# Altium schematic sheet UWB_Sheet.SchDoc
size 420 x 297 mm; SheetNumber: 3; SheetTotal: 5
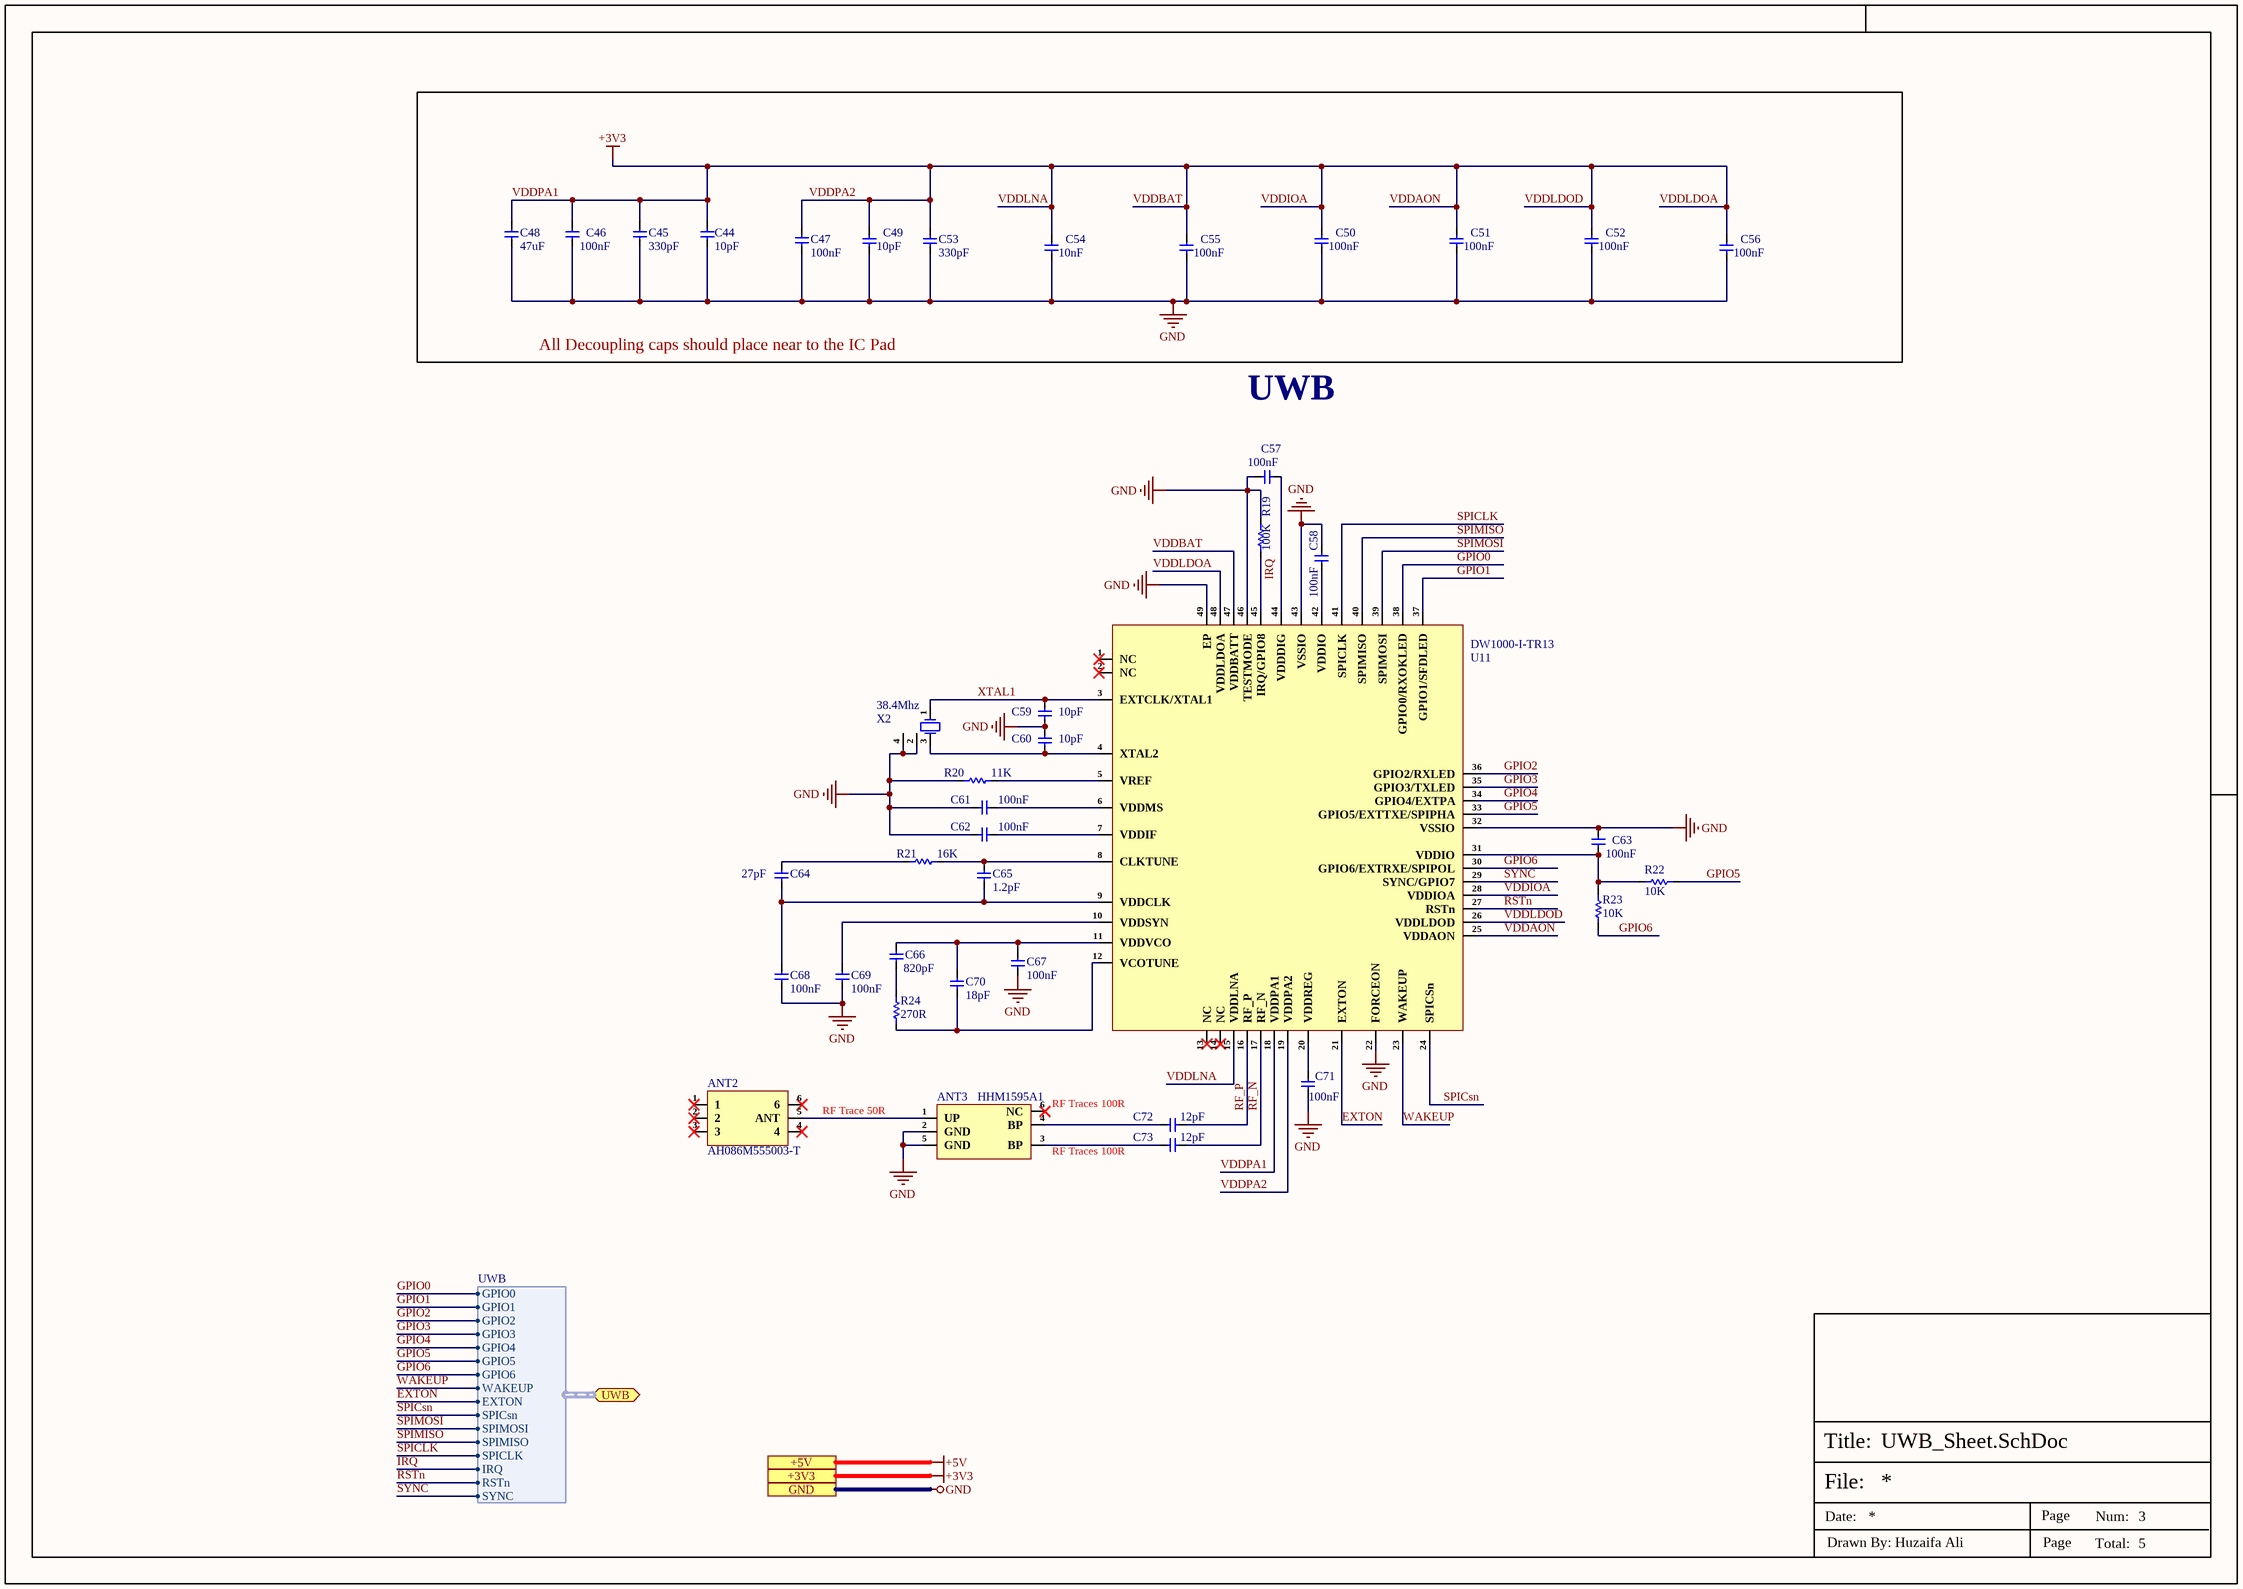
[diagram p0: UWB_Sheet.SchDoc]

## Parts
ANT2  AH086M555003-T  [AH086M555003-T]
ANT3  HHM1595A1  [HHM1595A1]
C44  10pF  [Cap-0402]
C45  330pF  [Cap-0402]
C46  100nF  [Cap-0402]
C47  100nF  [Cap-0402]
C48  47uF  [Cap-0603]
C49  10pF  [Cap-0402]
C50  100nF  [Cap-0402]
C51  100nF  [Cap-0402]
C52  100nF  [Cap-0402]
C53  330pF  [Cap-0402]
C54  10nF  [Cap-0402]
C55  100nF  [Cap-0402]
C56  100nF  [Cap-0402]
C57  100nF  [Cap-0402]
C58  100nF  [Cap-0402]
C59  10pF  [Cap-0402]
C60  10pF  [Cap-0402]
C61  100nF  [Cap-0402]
C62  100nF  [Cap-0402]
C63  100nF  [Cap-0402]
C64  27pF  [Cap-0402]
C65  1.2pF  [Cap-0402]
C66  820pF  [Cap-0603]
C67  100nF  [Cap-0402]
C68  100nF  [Cap-0402]
C69  100nF  [Cap-0402]
C70  18pF  [CAP-0201]
C71  100nF  [Cap-0402]
C72  12pF  [Cap-0402]
C73  12pF  [Cap-0402]
R19  100K  [Res-0402]
R20  11K  [Res-0402]
R21  16K  [Res-0201]
R22  10K  [Res-0402]
R23  10K  [Res-0402]
R24  270R  [Res-0402]
U11  DW1000-I-TR13  [QFN-48-EP(6x6)]
X2  38.4Mhz  [XC21M4-38.400-F10NNHPK]

## Blocks framed on the sheet
All Decoupling caps should place near to the IC Pad: C44-C56

## Ports
+3V3, +5V, GND, UWB (bidir, harness UWB)

## Harnesses
UWB: GPIO0, GPIO1, GPIO2, GPIO3, GPIO4, GPIO5, GPIO6, WAKEUP, EXTON, SPICsn, SPIMOSI, SPIMISO, SPICLK, IRQ, RSTn, SYNC

## Nets
+5V: port +5V
GND: ANT3.2(GND) ANT3.5(GND) C44.1 C45.1 C46.1 C47.2 C48.1 C49.1 C50.1 C51.1 C52.1 C53.1 C54.1 C55.1 C56.1 C57.1 C58.2 C59.1 C60.2 C61.2 C62.2 C63.2 C67.1 C68.1 C69.1 C71.2 R19.2 R20.1 U11.22(FORCEON) U11.32(VSSIO) U11.43(VSSIO) U11.46(TESTMODE) U11.49(EP) X2.2(GND) X2.4(GND) ; port GND
VDDAON: C44.2 C45.2 C46.2 C47.1 C48.2 C49.2 C50.2 C51.2 C52.2 C53.2 C54.2 C55.2 C56.2 U11.15(VDDLNA) U11.18(VDDPA1) U11.19(VDDPA2) U11.25(VDDAON) U11.26(VDDLDOD) U11.28(VDDIOA) U11.47(VDDBATT) U11.48(VDDLDOA) ; port +3V3  [also labelled +3V3, VDDBAT, VDDIOA, VDDLDOA, VDDLDOD, VDDLNA, VDDPA1, VDDPA2]
EXTON: U11.21(EXTON) ; port UWB.EXTON
GPIO0: U11.38(GPIO0/RXOKLED) ; port UWB.GPIO0
GPIO1: U11.37(GPIO1/SFDLED) ; port UWB.GPIO1
GPIO2: U11.36(GPIO2/RXLED) ; port UWB.GPIO2
GPIO3: U11.35(GPIO3/TXLED) ; port UWB.GPIO3
GPIO4: U11.34(GPIO4/EXTPA) ; port UWB.GPIO4
GPIO5: R22.2 U11.33(GPIO5/EXTTXE/SPIPHA) ; port UWB.GPIO5
GPIO6: R23.1 U11.30(GPIO6/EXTRXE/SPIPOL) ; port UWB.GPIO6
IRQ: R19.1 U11.45(IRQ/GPIO8) ; port UWB.IRQ
RF_N: C73.2 U11.17(RF_N)
RF_P: C72.2 U11.16(RF_P)
RSTn: U11.27(RSTn) ; port UWB.RSTn
SPICLK: U11.41(SPICLK) ; port UWB.SPICLK
SPICsn: U11.24(SPICSn) ; port UWB.SPICsn
SPIMISO: U11.40(SPIMISO) ; port UWB.SPIMISO
SPIMOSI: U11.39(SPIMOSI) ; port UWB.SPIMOSI
SYNC: U11.29(SYNC/GPIO7) ; port UWB.SYNC
WAKEUP: U11.23(WAKEUP) ; port UWB.WAKEUP
XTAL1: C59.2 U11.3(EXTCLK/XTAL1) X2.1(OSC1)
NetANT2_5: ANT2.5(ANT) ANT3.1(UP)
NetANT3_3: ANT3.3(BP) C73.1
NetANT3_4: ANT3.4(BP) C72.1
NetC57_2: C57.2 U11.44(VDDDIG)
NetC58_1: C58.1 U11.42(VDDIO)
NetC60_1: C60.1 U11.4(XTAL2) X2.3(OSC2)
NetC61_1: C61.1 U11.6(VDDMS)
NetC62_1: C62.1 U11.7(VDDIF)
NetC63_1: C63.1 R22.1 R23.2 U11.31(VDDIO)
NetC64_1: C64.1 C65.1 C68.2 U11.9(VDDCLK)
NetC64_2: C64.2 R21.1
NetC65_2: C65.2 R21.2 U11.8(CLKTUNE)
NetC66_1: C66.1 R24.2
NetC66_2: C66.2 C67.2 C70.2 U11.11(VDDVCO)
NetC69_2: C69.2 U11.10(VDDSYN)
NetC70_1: C70.1 R24.1 U11.12(VCOTUNE)
NetC71_1: C71.1 U11.20(VDDREG)
NetR20_2: R20.2 U11.5(VREF)

Not connected (* = marked no-connect by the designer): ANT2 1* 2* 3* 4* 6*; ANT3 6(NC)*; U11 1(NC)* 2(NC)* 13(NC)* 14(NC)*

## Notes on the sheet
- UWB
- RF Trace 50R
- (near ANT3) RF Traces 100R
- File:
- Title:
- Date:
- Page
- Num:
- Total:
- Drawn By: Huzaifa Ali

## Library data of the parts
ANT2 = AH086M555003-T: RF ANT 3.5GHZ/5.6GHZ CHIP SLD; Manufacturer: Taiyo Yuden; Item Type: RF Antennas; Supplier: Digikey; LCSC Part Number: C94132; Manufacturer Part Number: AH086M555003-T; RoHS: Yes; Stock: 4192; Pricing: 1=7.98, 10=5.341, 25=4.6536, 100=3.8766, 250=3.49504, 500=3.375 (USD); ComponentLink1URL: https://datasheet.ciiva.com/2791/ah-086m555003-ss-2791894.pdf?src-supplier=Digikey; ComponentLink1Description: https://datasheet.ciiva.com/2791/ah-086m555003-ss-2791894.pdf?src-supplier=Digikey; ComponentLink2URL: https://datasheet.ciiva.com/28414/1918813-28414122.pdf?src-supplier=Element14; ComponentLink2Description: https://datasheet.ciiva.com/28414/1918813-28414122.pdf?src-supplier=Element14; ComponentLink3URL: https://datasheet.ciiva.com/3306/chipantenna01-e-3306567.pdf?src-supplier=Avnet; ComponentLink3Description: https://datasheet.ciiva.com/3306/chipantenna01-e-3306567.pdf?src-supplier=Avnet; ComponentLink4URL: https://datasheet.ciiva.com/8153/chipantenna01-e-8153000.pdf?src-supplier=Avnet; ComponentLink4Description: https://datasheet.ciiva.com/8153/chipantenna01-e-8153000.pdf?src-supplier=Avnet; ComponentLink5URL: https://datasheet.ciiva.com/1125/chipantenna01-e-1125194.pdf?src-supplier=Element14; ComponentLink5Description: https://datasheet.ciiva.com/1125/chipantenna01-e-1125194.pdf?src-supplier=Element14; ComponentLink6URL: https://datasheet.ciiva.com/2791/chipantenna01-e-2791895.pdf?src-supplier=Digikey; ComponentLink6Description: https://datasheet.ciiva.com/2791/chipantenna01-e-2791895.pdf?src-supplier=Digikey; ComponentLink7URL: https://datasheet.ciiva.com/2791/chipantenna01-e-2791896.pdf?src-supplier=Digikey; ComponentLink7Description: https://datasheet.ciiva.com/2791/chipantenna01-e-2791896.pdf?src-supplier=Digikey
ANT3 = HHM1595A1: BALUN 3GHZ-8GHZ 50/100 0805; Manufacturer: TDK; Item Type: C112665; Supplier: Digikey; LCSC Part Number: C112665; Manufacturer Part Number: HHM1595A1; RoHS: Yes; Stock: 8835; Pricing: 1=0.34, 10=0.312, 25=0.3008, 50=0.292, 100=0.2836, 250=0.27264, 500=0.26456, 1000=0.25667 (USD); ComponentLink1URL: https://datasheet.ciiva.com/4547/e751-multibalun-hhm18-20070-4547862.pdf?src-supplier=Mouser; ComponentLink1Description: https://datasheet.ciiva.com/4547/e751-multibalun-hhm18-20070-4547862.pdf?src-supplier=Mouser; ComponentLink2URL: https://datasheet.ciiva.com/30013/rf-balun-hhm1595a1-en-30013313.pdf?src-supplier=Avnet; ComponentLink2Description: https://datasheet.ciiva.com/30013/rf-balun-hhm1595a1-en-30013313.pdf?src-supplier=Avnet; ComponentLink3URL: https://datasheet.ciiva.com/2788/rf-balun-hhm1583b1-en-2788708.pdf?src-supplier=Digikey; ComponentLink3Description: https://datasheet.ciiva.com/2788/rf-balun-hhm1583b1-en-2788708.pdf?src-supplier=Digikey; ComponentLink4URL: https://datasheet.ciiva.com/2788/rf-balun-hhm1583b1-en-2788709.pdf?src-supplier=Digikey; ComponentLink4Description: https://datasheet.ciiva.com/2788/rf-balun-hhm1583b1-en-2788709.pdf?src-supplier=Digikey; ComponentLink5URL: https://datasheet.ciiva.com/2788/rf-balun-hhm1583b1-en-2788710.pdf?src-supplier=Digikey; ComponentLink5Description: https://datasheet.ciiva.com/2788/rf-balun-hhm1583b1-en-2788710.pdf?src-supplier=Digikey
C44 C49 C59 C60 = GRM1555C1H100JA01D: CAP CER 10PF 50V C0G/NP0 0402; Manufacturer: Murata; Material: Ceramic; Dielectric: C0G; Tolerance: 5%; Item Type: Capacitor; Supplier: Arrow Electronics; Supplier Part Number: GRM1555C1H100JA01D; Manufacturer Part Number: GRM1555C1H100JA01D; RoHS: Yes; Category: Ceramic Capacitors; Stock: 3860000; Pricing: 10000=0.0034, 50000=0.0027, 100000=0.0023, 250000=0.0021 (USD); Mounting Technology: Surface Mount; Case/Package: 0402; Case Code (Metric): 1005; Case Code (Imperial): 0402; Min Operating Temperature: -55°C; Max Operating Temperature: 125°C; Value: 10pF; Voltage Rating: 50V; Packaging: Tape and Reel; Package Quantity: 1; Voltage Rating (DC): 50V; Termination: SMD/SMT; Series: GRM; Voltage: 50V; Construction: Flat; Length: 1mm; Width: 0.02inch; Height: 0.5mm; Depth: 0.5mm; Thickness: 0.022inch; Radiation Hardening: No; RoHS Compliant: Yes; Lead Free: Lead Free; Reach SVHC Compliant: No; ComponentLink1URL: https://datasheet.ciiva.com/2989/product-2989280.pdf?src-supplier=Avnet; ComponentLink1Description: https://datasheet.ciiva.com/2989/product-2989280.pdf?src-supplier=Avnet; ComponentLink2URL: https://datasheet.ciiva.com/18184/getdatasheetpartid-307234-18184164.pdf?src-supplier=Verical; ComponentLink2Description: https://datasheet.ciiva.com/18184/getdatasheetpartid-307234-18184164.pdf?src-supplier=Verical; ComponentLink3URL: https://datasheet.ciiva.com/29200/453545-da-01-en-vs-kondensator-0402-29200107.pdf?src-supplier=Conrad; ComponentLink3Description: https://datasheet.ciiva.com/29200/453545-da-01-en-vs-kondensator-0402-29200107.pdf?src-supplier=Conrad; ComponentLink4URL: https://datasheet.ciiva.com/7828/1666664-7828812.pdf?src-supplier=Element14; ComponentLink4Description: https://datasheet.ciiva.com/7828/1666664-7828812.pdf?src-supplier=Element14; ComponentLink5URL: https://datasheet.ciiva.com/6271/partnumbering-e-01-6271159.pdf?src-supplier=Digi-Key; ComponentLink5Description: https://datasheet.ciiva.com/6271/partnumbering-e-01-6271159.pdf?src-supplier=Digi-Key; ComponentLink6URL: https://datasheet.ciiva.com/6271/partnumbering-e-01-6271158.pdf?src-supplier=Digi-Key; ComponentLink6Description: https://datasheet.ciiva.com/6271/partnumbering-e-01-6271158.pdf?src-supplier=Digi-Key; ComponentLink7URL: https://datasheet.ciiva.com/6271/partnumbering-e-01-6271068.pdf?src-supplier=Digi-Key; ComponentLink7Description: https://datasheet.ciiva.com/6271/partnumbering-e-01-6271068.pdf?src-supplier=Digi-Key; LCSC Part Number: C76946
C45 C53 = CC0402JRX7R9BB331: CAP CER 330PF 50V X7R 0402; Manufacturer: Yageo; Item Type: Capacitors; Supplier: Digikey; LCSC Part Number: C325463; Manufacturer Part Number: CC0402JRX7R9BB331; RoHS: Yes; Stock: 55732; Pricing: 1=0.1, 10=0.028, 100=0.0157, 1000=0.00973, 2500=0.00781, 5000=0.00736 (USD); Pins: 2NUMBER; Lead Free: 5697LeadFree; RoHS Compliant: 5897YesNo; ComponentLink1URL: https://datasheet.ciiva.com/13263/upy-gphc-x7r-6-3v-to-50v-8-12304-13263927.pdf?src-supplier=Mouser; ComponentLink1Description: https://datasheet.ciiva.com/13263/upy-gphc-x7r-6-3v-to-50v-8-12304-13263927.pdf?src-supplier=Mouser
C46 C47 C50-C52 C55-C58 C61-C63 C67-C69 C71 = GRM155R71H104KE14D: CAP CER 0.1UF 50V X7R 0402; Manufacturer: Murata; Item Type: Capacitors; Material: Ceramic; Tolerance: 10%; Dissipation Factor: 0.025%; Supplier: Future Electronics; LCSC Part Number: C77020; Manufacturer Part Number: GRM155R71H104KE14D; RoHS: Yes; Stock: 45820000; Pricing: 10000=0.0034, 40000=0.0033, 150000=0.0032, 250000=0.0031, 500000=0.003 (USD); Mounting Technology: Surface Mount; Case/Package: 0402; Pins: 2NUMBER; Case Code (Metric): 1005; Case Code (Imperial): 0402; Weight: 0.000212oz; Dielectric Material: Ceramic; Min Operating Temperature: -55°C; Max Operating Temperature: 125°C; Packaging: Tape and Reel; Dielectric: X7R; Value: 100nF; Voltage Rating: 50V; Termination: SMD/SMT; Voltage: 50V; Voltage Rating (DC): 50V; Package Quantity: 10000; Series: GRM; Construction: Flat; Length: 1mm; Width: 0.5mm; Height: 0.5mm; Thickness: 0.022inch; Depth: 0.5mm; Lead Free: 5697LeadFree; Reach SVHC Compliant: No; RoHS Compliant: Yes; ComponentLink1URL: http://www.farnell.com/datasheets/2079156.pdf?src-supplier=Farnell; ComponentLink1Description: http://www.farnell.com/datasheets/2079156.pdf?src-supplier=Farnell; ComponentLink2URL: http://www.mouser.com/ds/2/281/c02e-2905.pdf?src-supplier=Mouser; ComponentLink2Description: http://www.mouser.com/ds/2/281/c02e-2905.pdf?src-supplier=Mouser; ComponentLink3URL: https://datasheet.octopart.com/GRM155R71H104KE14D-Murata-datasheet-22122223.pdf?src-supplier=Future+Electronics; ComponentLink3Description: https://datasheet.octopart.com/GRM155R71H104KE14D-Murata-datasheet-22122223.pdf?src-supplier=Future+Electronics; ComponentLink4URL: http://www.farnell.com/datasheets/2079156.pdf?src-supplier=Newark; ComponentLink4Description: http://www.farnell.com/datasheets/2079156.pdf?src-supplier=Newark; ComponentLink5URL: https://datasheet.octopart.com/GRM155R71H104KE14D-Murata-datasheet-66077078.pdf?src-supplier=Element14; ComponentLink5Description: https://datasheet.octopart.com/GRM155R71H104KE14D-Murata-datasheet-66077078.pdf?src-supplier=Element14; ComponentLink6URL: https://search.murata.co.jp/Ceramy/image/img/A01X/G101/ENG/GRM155R71H104KE14-01.pdf?src-supplier=Digikey; ComponentLink6Description: https://search.murata.co.jp/Ceramy/image/img/A01X/G101/ENG/GRM155R71H104KE14-01.pdf?src-supplier=Digikey
C48 = GRM188R60J476ME15D: CAP CER 47UF 6.3V X5R 0603; Manufacturer: Murata; Item Type: Capacitors; Material: 4241ConductorMaterial; Dielectric: 1537DielectricType; Supplier: Future Electronics; LCSC Part Number: C140782; Manufacturer Part Number: GRM188R60J476ME15D; RoHS: Yes; Stock: 324000; Pricing: 4000=0.108, 8000=0.106, 12000=0.105, 16000=0.104, 20000=0.102 (USD); Voltage Rating (DC): 6.3V; Height: 1mm; ComponentLink1URL: https://datasheet.octopart.com/GRM188R60J476ME15D-Murata-datasheet-149523200.pdf?src-supplier=Newark; ComponentLink1Description: https://datasheet.octopart.com/GRM188R60J476ME15D-Murata-datasheet-149523200.pdf?src-supplier=Newark; ComponentLink2URL: https://datasheet.octopart.com/GRM188R60J476ME15D-Murata-datasheet-102370999.pdf?src-supplier=Future+Electronics; ComponentLink2Description: https://datasheet.octopart.com/GRM188R60J476ME15D-Murata-datasheet-102370999.pdf?src-supplier=Future+Electronics; ComponentLink3URL: https://www.murata.com/~/media/webrenewal/support/library/catalog/products/capacitor/mlcc/c02e.ashx?la=en-us&src-supplier=Digikey; ComponentLink3Description: https://www.murata.com/~/media/webrenewal/support/library/catalog/products/capacitor/mlcc/c02e.ashx?la=en-us&src-supplier=Digikey; ComponentLink4URL: http://search.murata.co.jp/Ceramy/image/img/A01X/G101/ENG/GRM188R60J476ME15-01.pdf?src-supplier=Digikey; ComponentLink4Description: http://search.murata.co.jp/Ceramy/image/img/A01X/G101/ENG/GRM188R60J476ME15-01.pdf?src-supplier=Digikey; ComponentLink5URL: https://datasheet.octopart.com/GRM188R60J476ME15D-Murata-datasheet-165579666.pdf?src-supplier=TME; ComponentLink5Description: https://datasheet.octopart.com/GRM188R60J476ME15D-Murata-datasheet-165579666.pdf?src-supplier=TME
C54 = GCM155R71H103JA55D: CAP CER 10000PF 50V X7R 0402; Manufacturer: Murata; Tolerance: 5%; Item Type: Capacitor; Supplier: Digikey; Supplier Part Number: 490-14352-2-ND; Manufacturer Part Number: GCM155R71H103JA55D; RoHS: Yes; Category: Ceramic Capacitors; Mounting Technology: Surface Mount; Case/Package: 0402; Case Code (Imperial): 0402; Case Code (Metric): 1005; Min Operating Temperature: -55°C; Max Operating Temperature: 125°C; Packaging: Cut Tape; Value: 10nF; Voltage Rating: 50V; Series: GCM; Ratings: AEC-Q200; RoHS Compliant: Yes; ComponentLink1URL: http://search.murata.co.jp/Ceramy/image/img/A01X/partnumbering_e_02.pdf?src-supplier=Digikey; ComponentLink1Description: http://search.murata.co.jp/Ceramy/image/img/A01X/partnumbering_e_02.pdf?src-supplier=Digikey; ComponentLink2URL: http://search.murata.co.jp/Ceramy/image/img/A01X/G101/ENG/GCM155R71H103JA55-01.pdf?src-supplier=Digikey; ComponentLink2Description: http://search.murata.co.jp/Ceramy/image/img/A01X/G101/ENG/GCM155R71H103JA55-01.pdf?src-supplier=Digikey; LCSC Part Number: C5189696
C64 = 0402N270J250CT: CAP CER 27PF 25V C0G/NP0 0402; Manufacturer: Walsin Technologies; Item Type: Capacitor; Supplier 1: Digi-Key; Manufacturer Part Number: 0402N270J250CT; Stock 1: 71180; Pricing 1: 1=0.1, 10=0.017, 50=0.0094, 100=0.0076, 500=0.00544, 1000=0.00427, 2500=0.00388, 5000=0.00357 (USD); RoHS Compliant: Yes; Supplier Part Number 1: 1292-1291-1-ND; LCSC Part Number: C424826; ComponentLink1Description: LCSC; ComponentLink1URL: https://lcsc.com/product-detail/Multilayer-Ceramic-Capacitors-MLCC-SMD-SMT_Walsin-Tech-Corp-0402N270J250CT_C424826.html
C65 = CC0402BRNPO9BN1R2: CAP CER 1.2PF 50V C0G/NPO 0402; Manufacturer: Yageo; Item Type: Capacitor; Temperature Coefficient: 30ppm/°C; Supplier: Digikey; LCSC Part Number: C327292; Manufacturer Part Number: CC0402BRNPO9BN1R2; RoHS: Yes; Stock: 92678; Pricing: 1=0.1, 10=0.032, 50=0.0184, 100=0.0142, 500=0.01068, 1000=0.00839, 2500=0.00762, 5000=0.00702 (USD); Halogen Free: 5694HalogenFree; ComponentLink1URL: https://datasheet.ciiva.com/13386/upy-gp-np0-16v-to-50v-8-13386283.pdf?src-supplier=Mouser; ComponentLink1Description: https://datasheet.ciiva.com/13386/upy-gp-np0-16v-to-50v-8-13386283.pdf?src-supplier=Mouser; ComponentLink2URL: https://datasheet.ciiva.com/15189/getdatasheetpartid-468320-15189100.pdf?src-supplier=Verical; ComponentLink2Description: https://datasheet.ciiva.com/15189/getdatasheetpartid-468320-15189100.pdf?src-supplier=Verical; ComponentLink3URL: https://datasheet.ciiva.com/11587/upy-gp-np0-16v-to-50v-8-11587117.pdf?src-supplier=Avnet; ComponentLink3Description: https://datasheet.ciiva.com/11587/upy-gp-np0-16v-to-50v-8-11587117.pdf?src-supplier=Avnet
C66 = CC0603JRNPO9BN821: CAP CER 820PF 50V C0G/NPO 0603; Manufacturer: Yageo; Item Type: Capacitors; Tolerance: 5%; Dielectric: C0G; Supplier: Arrow Electronics; LCSC Part Number: C107057; Manufacturer Part Number: CC0603JRNPO9BN821; RoHS: Yes; Stock: 772000; Pricing: 4000=0.0129, 24000=0.0087, 48000=0.0086 (USD); Mounting Technology: Surface Mount; Case/Package: 0603; Pins: 2; Case Code (Imperial): 0603; Case Code (Metric): 1608; Min Operating Temperature: -55°C; Max Operating Temperature: 125°C; Packaging: Tape and Reel; Value: 820pF; Voltage Rating: 50V; Voltage Rating (DC): 50V; Termination: SMD/SMT; Series: CC; Length: 1.6mm; Width: 0.031inch; Height: 0.8mm; Thickness: 0.035inch; Depth: 0.8mm; Radiation Hardening: No; Lead Free: Lead Free; RoHS Compliant: Yes; ComponentLink1URL: https://datasheet.ciiva.com/26829/getdatasheetpartid-403541-26829388.pdf?src-supplier=Verical; ComponentLink1Description: https://datasheet.ciiva.com/26829/getdatasheetpartid-403541-26829388.pdf?src-supplier=Verical
C70 = GJM0335C1E180GB01D: CAP CER 18PF 25V C0G/NP0 0201; Manufacturer: Murata Electronics; Item Type: Capacitor; Manufacturer Part Number: GJM0335C1E180GB01D; Package: 0201; LCSC Part Number: C913481; ComponentLink1Description: LCSC; Supplier: Rs; Supplier Part Number: 1853317; RoHS: Yes; Category: Ceramic Capacitors; Stock: 15000; Pricing: 1000=0.018, 5000=0.015, 10000=0.012 (GBP); ComponentLink2URL: http://www.mouser.com/ds/2/281/c02e-2905.pdf?src-supplier=Mouser; ComponentLink2Description: http://www.mouser.com/ds/2/281/c02e-2905.pdf?src-supplier=Mouser; ComponentLink3URL: https://datasheet.octopart.com/GJM0335C1E180GB01D-Murata-datasheet-22122223.pdf?src-supplier=Future+Electronics; ComponentLink3Description: https://datasheet.octopart.com/GJM0335C1E180GB01D-Murata-datasheet-22122223.pdf?src-supplier=Future+Electronics; ComponentLink4URL: https://search.murata.co.jp/Ceramy/image/img/A01X/G101/ENG/GJM0335C1E180GB01-01.pdf?src-supplier=Digi-Key; ComponentLink4Description: https://search.murata.co.jp/Ceramy/image/img/A01X/G101/ENG/GJM0335C1E180GB01-01.pdf?src-supplier=Digi-Key; ComponentLink5URL: http://search.murata.co.jp/Ceramy/image/img/A01X/G101/ENG/GJM0335C1E180GB01-01.pdf?src-supplier=Digi-Key; ComponentLink5Description: http://search.murata.co.jp/Ceramy/image/img/A01X/G101/ENG/GJM0335C1E180GB01-01.pdf?src-supplier=Digi-Key; ComponentLink6URL: https://datasheet.octopart.com/GJM0335C1E180GB01D-Murata-datasheet-12511495.pdf?src-supplier=TME; ComponentLink6Description: https://datasheet.octopart.com/GJM0335C1E180GB01D-Murata-datasheet-12511495.pdf?src-supplier=TME
C72 C73 = GJM1555C1H120GB01D: CAP CER 12PF 50V C0G/NP0 0402; Manufacturer: Murata; Tolerance: 2%; Dielectric: C0G; Supplier 1: Digi-Key; Manufacturer Part Number: GJM1555C1H120GB01D; RoHS: Yes; Category: Ceramic Capacitors; Stock 1: 266975; Pricing 1: 1=0.18000, 10=0.12600, 50=0.07560, 100=0.06390, 500=0.04370, 1000=0.03865, 2500=0.03698, 5000=0.03361 (USD); Mount: Surface Mount; Case/Package: 0402; Case Code (Imperial): 0402; Case Code (Metric): 1005; Min Operating Temperature: -55°C; Max Operating Temperature: 125°C; Capacitance: 12pF; Voltage Rating: 50V; Voltage Rating (DC): 50V; Packaging: Tape and Reel; Package Quantity: 10000; Termination: SMD/SMT; Series: GJM; Construction: Flat; Length: 1mm; Width: 0.5mm; Height: 0.5mm; Thickness: 0.022inch; Depth: 0.5mm; Radiation Hardening: No; Lead Free: Lead Free; RoHS Compliant: Yes; ComponentLink1URL: https://datasheet.ciiva.com/11608/product-11608208.pdf?src-supplier=Avnet; ComponentLink1Description: https://datasheet.ciiva.com/11608/product-11608208.pdf?src-supplier=Avnet; ComponentLink2URL: https://datasheet.ciiva.com/29542/partnumbering-e-01-29542716.pdf?src-supplier=Digi-Key; ComponentLink2Description: https://datasheet.ciiva.com/29542/partnumbering-e-01-29542716.pdf?src-supplier=Digi-Key; ComponentLink3URL: https://datasheet.ciiva.com/29542/partnumbering-e-01-29542715.pdf?src-supplier=Digi-Key; ComponentLink3Description: https://datasheet.ciiva.com/29542/partnumbering-e-01-29542715.pdf?src-supplier=Digi-Key; ComponentLink4URL: https://datasheet.ciiva.com/29542/partnumbering-e-01-29542717.pdf?src-supplier=Digi-Key; ComponentLink4Description: https://datasheet.ciiva.com/29542/partnumbering-e-01-29542717.pdf?src-supplier=Digi-Key; Supplier Part Number 1: 490-8078-1-ND; LCSC Part Number: C161305
R19 = RC0402FR-07100KL: RES 100K OHM 1% 1/16W 0402; Manufacturer: Yageo; Resistance: 100kR; Temperature Coefficient: 100ppm/°C; Power Rating: 63mW; Voltage Rating: 50V; Item Type: Resistor; Supplier 1: Mouser; Manufacturer Part Number: RC0402FR-07100KL; RoHS: Yes; Category: Chip SMD Resistors; Stock 1: 7759549; Pricing 1: 1=0.10000, 10=0.01200, 50=0.01200, 100=0.00500, 1000=0.00300, 2500=0.00200, 10000=0.00100 (USD); Case/Package: 0402; Case Code (Metric): 1005; Case Code (Imperial): 0402; Min Operating Temperature: -55°C; Max Operating Temperature: 155°C; Resistor Type: Thick Film; Tolerance: 1%; Packaging: Tape and Reel; Package Quantity: 1; Number of Terminations: 2; Termination: SMD/SMT; Max Power Dissipation: 63mW; Working Voltage: 50V; Features: Moisture Resistant; Series: RC; Resistance Tolerance: 1%; Construction: Rectangular; Technology: THICK FILM; Length: 0.039inch; Width: 0.02inch; Height: 0.016inch; Depth: 0.5mm; REACH SVHC: No SVHC; Lead Free: Lead Free; RoHS Compliant: Yes; Military Standard: Not; ComponentLink1URL: https://datasheet.ciiva.com/11819/0900766b80c66297-11819452.pdf?src-supplier=RSComponents; ComponentLink1Description: https://datasheet.ciiva.com/11819/0900766b80c66297-11819452.pdf?src-supplier=RSComponents; ComponentLink2URL: https://datasheet.ciiva.com/22747/1018594-22747509.pdf?src-supplier=Element14; ComponentLink2Description: https://datasheet.ciiva.com/22747/1018594-22747509.pdf?src-supplier=Element14; ComponentLink3URL: https://datasheet.ciiva.com/2453/pyu-r-int-thick-7-2453362.pdf?src-supplier=Digi-Key; ComponentLink3Description: https://datasheet.ciiva.com/2453/pyu-r-int-thick-7-2453362.pdf?src-supplier=Digi-Key; ComponentLink4URL: https://datasheet.ciiva.com/2453/pyu-r-int-thick-7-2453363.pdf?src-supplier=Digi-Key; ComponentLink4Description: https://datasheet.ciiva.com/2453/pyu-r-int-thick-7-2453363.pdf?src-supplier=Digi-Key; ComponentLink5URL: https://datasheet.ciiva.com/2453/pyu-r-int-thick-7-2453361.pdf?src-supplier=Digi-Key; ComponentLink5Description: https://datasheet.ciiva.com/2453/pyu-r-int-thick-7-2453361.pdf?src-supplier=Digi-Key; ComponentLink6URL: https://datasheet.ciiva.com/12667/pyu-rc0402-51-rohs-l-6-r-12667930.pdf?src-supplier=Mouser; ComponentLink6Description: https://datasheet.ciiva.com/12667/pyu-rc0402-51-rohs-l-6-r-12667930.pdf?src-supplier=Mouser; ComponentLink7URL: https://datasheet.ciiva.com/15189/getdatasheetpartid-323696-15189334.pdf?src-supplier=Verical; ComponentLink7Description: https://datasheet.ciiva.com/15189/getdatasheetpartid-323696-15189334.pdf?src-supplier=Verical; Supplier Part Number 1: 603-RC0402FR-07100KL; LCSC Part Number: C60491
R20 = RC0402FR-0711KL: RES 11K OHM 1% 1/16W 0402; Manufacturer: Yageo; Item Type: Resistors; Power Rating: 63mW; Voltage Rating: 50V; Value: 11kR; Temperature Coefficient: 100ppm/°C; Supplier: Future Electronics; LCSC Part Number: C138063; Manufacturer Part Number: RC0402FR-0711KL; RoHS: Yes; Stock: 350000; Pricing: 10000=0.0018, 100000=0.0011, 150000=0.0017, 300000=0.001, 500000=0.0016, 750000=0.001, 1500000=0.0015, 2000000=0.0009, 5000000=0.0014 (USD); Case/Package: 0402; Pins: 2; Case Code (Metric): 1005; Case Code (Imperial): 0402; Min Operating Temperature: -55°C; Max Operating Temperature: 155°C; Tolerance: 1%; Packaging: Tape and Reel; Package Quantity: 1; Resistor Type: Thick Film; Number of Terminations: 2; Termination: SMD/SMT; Max Power Dissipation: 63mW; Voltage Rating (DC): 50V; Features: Moisture Resistant; Series: RC; Resistance Tolerance: 1%; Length: 0.039inch; Width: 0.02inch; Height: 0.016inch; RoHS Compliant: Yes; Reach SVHC Compliant: No; Lead Free: Lead Free; ComponentLink1URL: https://datasheet.ciiva.com/5999/1018594-5999918.pdf?src-supplier=Farnell; ComponentLink1Description: https://datasheet.ciiva.com/5999/1018594-5999918.pdf?src-supplier=Farnell; ComponentLink2URL: https://datasheet.ciiva.com/2453/pyu-r-int-thick-7-2453641.pdf?src-supplier=Digikey; ComponentLink2Description: https://datasheet.ciiva.com/2453/pyu-r-int-thick-7-2453641.pdf?src-supplier=Digikey; ComponentLink3URL: https://datasheet.ciiva.com/2453/pyu-r-int-thick-7-2453642.pdf?src-supplier=Digikey; ComponentLink3Description: https://datasheet.ciiva.com/2453/pyu-r-int-thick-7-2453642.pdf?src-supplier=Digikey; ComponentLink4URL: https://datasheet.ciiva.com/2453/pyu-r-int-thick-7-2453640.pdf?src-supplier=Digikey; ComponentLink4Description: https://datasheet.ciiva.com/2453/pyu-r-int-thick-7-2453640.pdf?src-supplier=Digikey; ComponentLink5URL: https://datasheet.ciiva.com/12668/pyu-rc0402-51-rohs-l-6-r-12668234.pdf?src-supplier=Mouser; ComponentLink5Description: https://datasheet.ciiva.com/12668/pyu-rc0402-51-rohs-l-6-r-12668234.pdf?src-supplier=Mouser
R21 = RC-01W1602FT: 50mW Thick Film Resistors 25V ±1% ±200ppm/℃ 16kΩ 0201 Chip Resistor - Surface Mount ROHS; Manufacturer: FH (Guangdong Fenghua Advanced Tech); Manufacturer Part Number: RC-01W1602FT; Package: 0201; LCSC Part Number: C320708; Item Type: Resistor; ComponentLink1Description: LCSC; ComponentLink1URL: https://www.lcsc.com/product-detail/Chip-Resistor-Surface-Mount_FH-Guangdong-Fenghua-Advanced-Tech-RC-01W1602FT_C320708.html
R22 R23 = RC0402FR-0710KL: RES 10K OHM 1% 1/16W 0402; Manufacturer: Yageo; Resistance: 10kR; Voltage Rating (DC): 50V; Temperature Coefficient: 100ppm/°C; Power Rating: 62.5mW; Max Power Dissipation: 63mW; Item Type: Resistor; Supplier 1: Mouser; Manufacturer Part Number: RC0402FR-0710KL; RoHS: Yes; Category: Chip SMD Resistors; Stock 1: 18648329; Pricing 1: 1=0.10000, 10=0.01400, 50=0.01400, 100=0.00500, 1000=0.00300, 10000=0.00200 (USD); Case/Package: 0402; Number of Pins: 2; Case Code (Imperial): 0402; Case Code (Metric): 1005; Min Operating Temperature: -55°C; Max Operating Temperature: 155°C; Resistor Type: Thick Film; Tolerance: 1%; Packaging: Tape and Reel; Voltage Rating: 50V; Termination: SMD/SMT; Working Voltage: 50V; Number of Terminations: 2; Features: Moisture Resistant; Series: RC; Resistance Tolerance: 1%; Construction: Rectangular; Length: 1mm; Width: 0.5mm; Height: 0.32mm; Depth: 0.5mm; Lead Pitch: 0.2mm; REACH SVHC: No SVHC; Lead Free: Lead Free; RoHS Compliant: Yes; Military Standard: Not; ComponentLink1URL: https://datasheet.ciiva.com/7660/38568-7660787.pdf?src-supplier=Element14; ComponentLink1Description: https://datasheet.ciiva.com/7660/38568-7660787.pdf?src-supplier=Element14; ComponentLink2URL: https://datasheet.ciiva.com/7849/1686128-7849814.pdf?src-supplier=Element14; ComponentLink2Description: https://datasheet.ciiva.com/7849/1686128-7849814.pdf?src-supplier=Element14; ComponentLink3URL: https://datasheet.ciiva.com/7983/1018594-7983486.pdf?src-supplier=Element14; ComponentLink3Description: https://datasheet.ciiva.com/7983/1018594-7983486.pdf?src-supplier=Element14; ComponentLink4URL: https://datasheet.ciiva.com/22747/1018594-22747512.pdf?src-supplier=Element14; ComponentLink4Description: https://datasheet.ciiva.com/22747/1018594-22747512.pdf?src-supplier=Element14; ComponentLink5URL: https://datasheet.ciiva.com/12667/pyu-rc0402-51-rohs-l-6-r-12667067.pdf?src-supplier=Mouser; ComponentLink5Description: https://datasheet.ciiva.com/12667/pyu-rc0402-51-rohs-l-6-r-12667067.pdf?src-supplier=Mouser; ComponentLink6URL: https://datasheet.ciiva.com/7849/1784430-7849813.pdf?src-supplier=Element14; ComponentLink6Description: https://datasheet.ciiva.com/7849/1784430-7849813.pdf?src-supplier=Element14; ComponentLink7URL: https://datasheet.ciiva.com/7849/1784430-7849815.pdf?src-supplier=Element14; ComponentLink7Description: https://datasheet.ciiva.com/7849/1784430-7849815.pdf?src-supplier=Element14; Supplier Part Number 1: 603-RC0402FR-0710KL; LCSC Part Number: C60490
R24 = ERJ-2RKF2700X: RES SMD 270 OHM 1% 1/10W 0402; Manufacturer: Panasonic; Item Type: Resistors; Voltage Rating (DC): 50V; Supplier: Mouser; LCSC Part Number: C278588; Manufacturer Part Number: ERJ-2RKF2700X; RoHS: Yes; Stock: 141131; Pricing: 1=0.1, 10=0.015, 50=0.015, 100=0.009, 1000=0.008, 10000=0.004 (USD); Lead Free: 5697LeadFree; ComponentLink1URL: https://datasheet.ciiva.com/11821/0900766b80f80784-11821240.pdf?src-supplier=Rs; ComponentLink1Description: https://datasheet.ciiva.com/11821/0900766b80f80784-11821240.pdf?src-supplier=Rs; ComponentLink2URL: https://datasheet.ciiva.com/46373/1678782-46373915.pdf?src-supplier=Element14; ComponentLink2Description: https://datasheet.ciiva.com/46373/1678782-46373915.pdf?src-supplier=Element14; ComponentLink3URL: https://datasheet.ciiva.com/46373/1678782-46373916.pdf?src-supplier=Element14; ComponentLink3Description: https://datasheet.ciiva.com/46373/1678782-46373916.pdf?src-supplier=Element14; ComponentLink4URL: https://datasheet.ciiva.com/16767/70260748-16767359.pdf?src-supplier=Allied+Electronics; ComponentLink4Description: https://datasheet.ciiva.com/16767/70260748-16767359.pdf?src-supplier=Allied+Electronics; ComponentLink5URL: https://datasheet.ciiva.com/7944/aoa0000ce2-7944940.pdf?src-supplier=Element14; ComponentLink5Description: https://datasheet.ciiva.com/7944/aoa0000ce2-7944940.pdf?src-supplier=Element14; ComponentLink6URL: https://datasheet.ciiva.com/22705/1678782-22705421.pdf?src-supplier=Element14; ComponentLink6Description: https://datasheet.ciiva.com/22705/1678782-22705421.pdf?src-supplier=Element14; ComponentLink7URL: https://datasheet.ciiva.com/7944/aoa0000ce2-7944606.pdf?src-supplier=Element14; ComponentLink7Description: https://datasheet.ciiva.com/7944/aoa0000ce2-7944606.pdf?src-supplier=Element14; ComponentLink8URL: https://datasheet.ciiva.com/24069/aoa0000ce2-24069133.pdf?src-supplier=Mouser; ComponentLink8Description: https://datasheet.ciiva.com/24069/aoa0000ce2-24069133.pdf?src-supplier=Mouser; ComponentLink9URL: https://datasheet.ciiva.com/9183/aoa0000ce2-9183598.pdf?src-supplier=Avnet; ComponentLink9Description: https://datasheet.ciiva.com/9183/aoa0000ce2-9183598.pdf?src-supplier=Avnet; ComponentLink10URL: https://datasheet.ciiva.com/43467/1678782-43467257.pdf?src-supplier=Farnell; ComponentLink10Description: https://datasheet.ciiva.com/43467/1678782-43467257.pdf?src-supplier=Farnell; ComponentLink11URL: https://datasheet.ciiva.com/5860/aoa0000ce2-5860650.pdf?src-supplier=Farnell; ComponentLink11Description: https://datasheet.ciiva.com/5860/aoa0000ce2-5860650.pdf?src-supplier=Farnell; ComponentLink12URL: https://datasheet.ciiva.com/9183/aoa0000ce2-9183566.pdf?src-supplier=Avnet; ComponentLink12Description: https://datasheet.ciiva.com/9183/aoa0000ce2-9183566.pdf?src-supplier=Avnet; ComponentLink13URL: https://datasheet.ciiva.com/16766/70260748-16766103.pdf?src-supplier=Allied+Electronics; ComponentLink13Description: https://datasheet.ciiva.com/16766/70260748-16766103.pdf?src-supplier=Allied+Electronics; ComponentLink14URL: https://datasheet.ciiva.com/30198/aoa0000ce2-30198389.pdf?src-supplier=Onlinecomponents.com; ComponentLink14Description: https://datasheet.ciiva.com/30198/aoa0000ce2-30198389.pdf?src-supplier=Onlinecomponents.com
U11 = DW1000-I-TR13: IC RF TXRX 802.15.4 48QFN; Manufacturer: Qorvo; Supplier: Mouser; LCSC Part Number: C5241969; Manufacturer Part Number: DW1000-I-TR13; RoHS: No; Item Type: IC; Stock: 7464; Pricing: 1=9.63, 10=9.63, 50=8.58, 100=7.88, 1000=6.13, 10000=4.55 (USD); ComponentLink1URL: https://datasheet.octopart.com/DW1000-I-TR13-Qorvo-datasheet-147457540.pdf?src-supplier=RFMW; ComponentLink1Description: https://datasheet.octopart.com/DW1000-I-TR13-Qorvo-datasheet-147457540.pdf?src-supplier=RFMW
X2 = XC21M4-38.400-F10NNHPK: CRYSTAL 38.4MHZ 10PF SMD; Manufacturer: Suzhou Hangjing Elec&Tech Co.,Ltd; Manufacturer Part Number: XC21M4-38.400-F10NNHPK; Package: 4-SMD, No Lead; LCSC Part Number: -; Item Type: Crystal; ComponentLink1Description: LCSC; ComponentLink1URL: *